# Altium schematic sheet ECG_AFE_ADS1292.SchDoc
size 420 x 297 mm; SheetNumber: 2; SheetTotal: 3
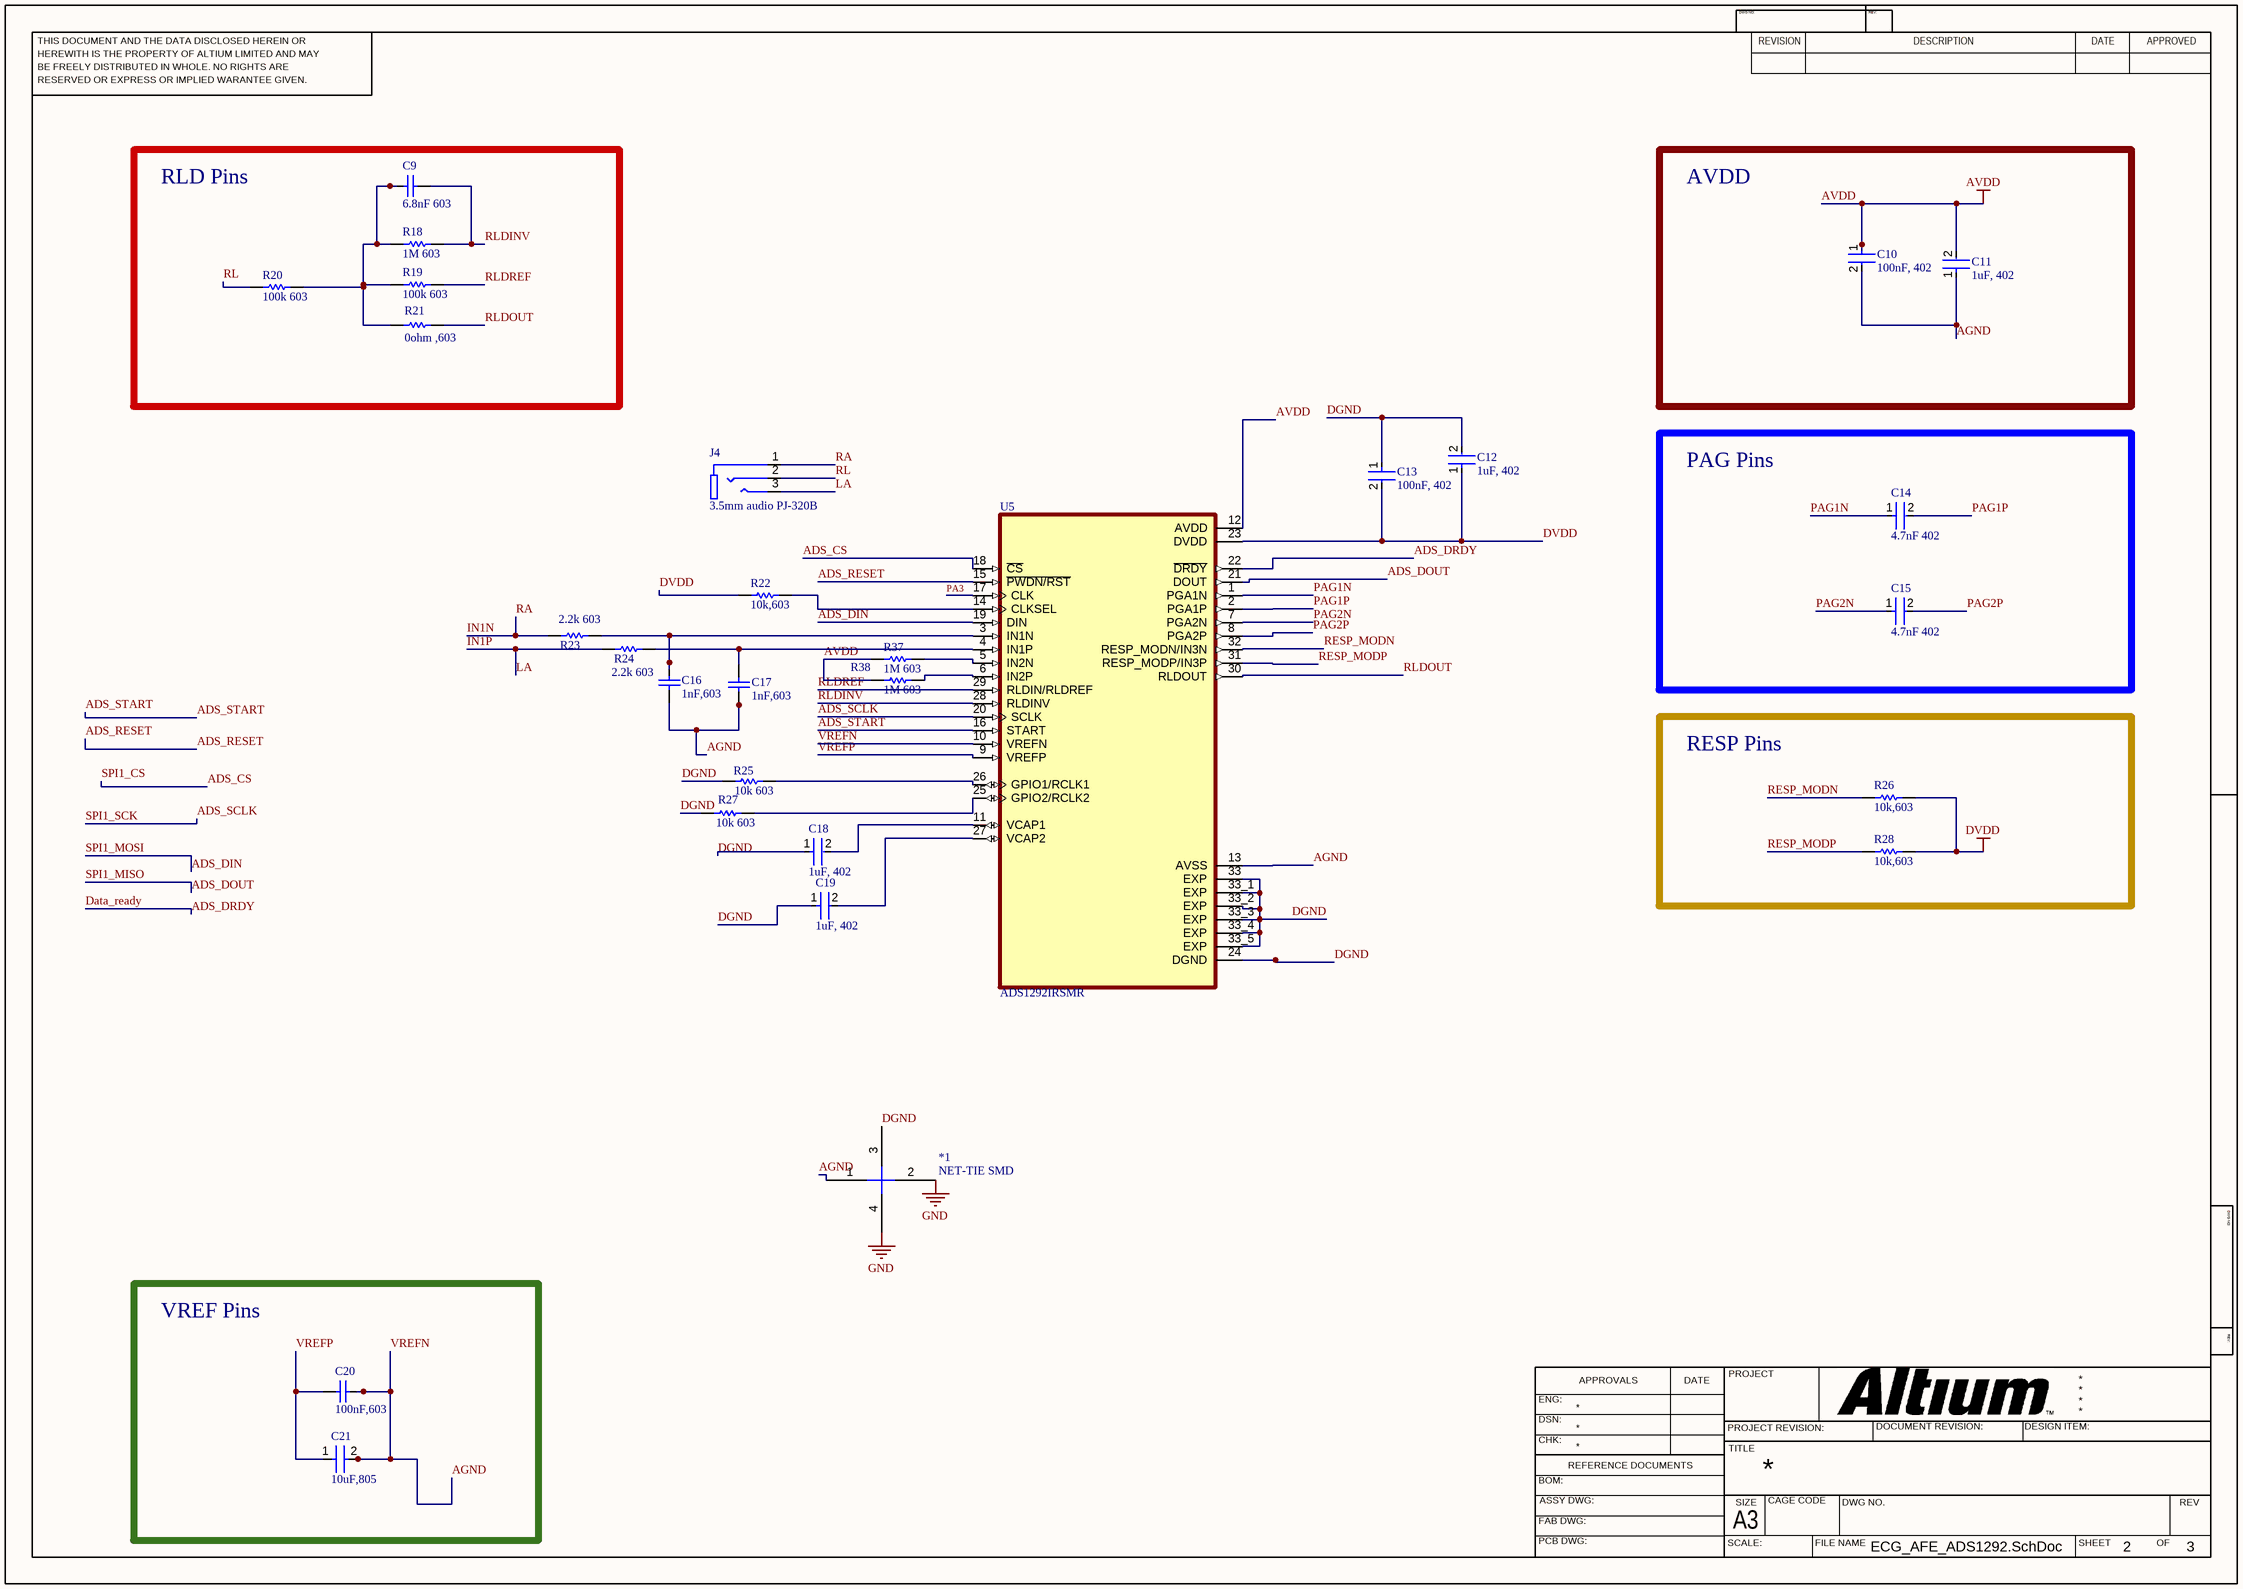
[diagram p0: ECG_AFE_ADS1292.SchDoc]

## Parts
*1  NET-TIE SMD  [NET TIE SMD]
C9  6.8nF 603  [CAP-0603-IPC_B]
C10  100nF, 402  [FP-CC0402-MFG]
C11  1uF, 402  [FP-CC0402-MFG]
C12  1uF, 402  [FP-CC0402-MFG]
C13  100nF, 402  [FP-CC0402-MFG]
C14  4.7nF 402  [FP-GRM188-0_1-e0_2_0_5-MFG]
C15  4.7nF 402  [FP-GRM188-0_1-e0_2_0_5-MFG]
C16  1nF,603  [CAP-0603-IPC_B]
C17  1nF,603  [CAP-0603-IPC_B]
C18  1uF, 402  [FP-CC0402-MFG]
C19  1uF, 402  [FP-CC0402-MFG]
C20  100nF,603  [CAP-0603-IPC_B]
C21  10uF,805  [CAP-0805-IPC_B]
J4  3.5mm audio PJ-320B  [3.5mm Audio PJ-320B]
R18  1M 603  [RES-0603-IPC_B]
R19  100k 603  [RES-0603-IPC_B]
R20  100k 603  [RES-0603-IPC_B]
R21  0ohm ,603  [RES-0603-IPC_B]
R22  10k,603  [RES-0603-IPC_B]
R23  2.2k 603  [RES-0603-IPC_B]
R24  2.2k 603  [RES-0603-IPC_B]
R25  10k 603  [RES-0603-IPC_B]
R26  10k,603  [RES-0603-IPC_B]
R27  10k 603  [RES-0603-IPC_B]
R28  10k,603  [RES-0603-IPC_B]
R37  1M 603  [RES-0603-IPC_B]
R38  1M 603  [RES-0603-IPC_B]
U5  ADS1292IRSMR  [ADS1292 SMD 32 PIN]

## Blocks framed on the sheet
RLD Pins: C9 R18-R21
AVDD: C10 C11
PAG Pins: C14 C15
RESP Pins: R26 R28
VREF Pins: C20 C21

## Nets
AVDD: C10.1 C11.2 R37.1 R38.1 U5.12(AVDD)
DVDD: C12.1 C13.2 R22.1 R26.2 R28.2 U5.23(DVDD)
GND: *1.2 *1.4
ADS_CS: U5.18(~{CS})  [also labelled SPI1_CS]
ADS_DIN: U5.19(DIN)  [also labelled SPI1_MOSI]
ADS_DOUT: U5.21(DOUT)  [also labelled SPI1_MISO]
ADS_DRDY: U5.22(~{DRDY})  [also labelled Data_ready]
ADS_RESET: U5.15(~{PWDN/RST})
ADS_SCLK: U5.20(SCLK)  [also labelled SPI1_SCK]
ADS_START: U5.16(START)
AGND: *1.1 C10.2 C11.1 C16.1 C17.1 C20.2 C21.2 U5.10(VREFN) U5.13(AVSS)  [also labelled VREFN]
DGND: *1.3 C12.2 C13.1 C18.1 C19.1 R25.1 R27.1 U5.24(DGND) U5.33(EXP) U5.33_1(EXP) U5.33_2(EXP) U5.33_3(EXP) U5.33_4(EXP) U5.33_5(EXP)
IN1N: J4.1(SLEEVE) R23.1  [also labelled RA]
IN1P: J4.3(TIP) R24.1  [also labelled LA]
PA3: U5.17(CLK)
PAG1N: C14.1 U5.1(PGA1N)
PAG1P: C14.2 U5.2(PGA1P)
PAG2N: C15.1 U5.7(PGA2N)
PAG2P: C15.2 U5.8(PGA2P)
RESP_MODN: R26.1 U5.32(RESP_MODN/IN3N)
RESP_MODP: R28.1 U5.31(RESP_MODP/IN3P)
RL: J4.2(RING) R20.1
RLDINV: C9.2 R18.2 U5.28(RLDINV)
RLDOUT: R21.2 U5.30(RLDOUT)
RLDREF: R19.2 U5.29(RLDIN/RLDREF)
VREFP: C20.1 C21.1 U5.9(VREFP)
NetC9_1: C9.1 R18.1 R19.1 R20.2 R21.1
NetC16_2: C16.2 R23.2 U5.3(IN1N)
NetC17_2: C17.2 R24.2 U5.4(IN1P)
NetC18_2: C18.2 U5.11(VCAP1)
NetC19_2: C19.2 U5.27(VCAP2)
NetR22_2: R22.2 U5.14(CLKSEL)
NetR25_2: R25.2 U5.26(GPIO1/RCLK1)
NetR27_2: R27.2 U5.25(GPIO2/RCLK2)
NetR37_2: R37.2 U5.5(IN2N)
NetR38_2: R38.2 U5.6(IN2P)

## Notes on the sheet
- THIS DOCUMENT AND THE DATA DISCLOSED HEREIN OR
- HEREWITH IS THE PROPERTY OF ALTIUM LIMITED AND MAY
- DWG NO:
- REVISION
- REV:
- DESCRIPTION
- DATE
- APPROVED
- BE FREELY DISTRIBUTED IN WHOLE. NO RIGHTS ARE
- RESERVED OR EXPRESS OR IMPLIED WARANTEE GIVEN.
- ENG:
- APPROVALS
- PROJECT
- DSN:
- CHK:
- REFERENCE DOCUMENTS
- PROJECT REVISION:
- TITLE
- DOCUMENT REVISION:
- DESIGN ITEM:
- BOM:
- FAB DWG:
- PCB DWG:
- ASSY DWG:
- SCALE:
- A3
- SIZE
- CAGE CODE
- FILE NAME
- DWG NO.
- SHEET
- OF
- REV

## Library data of the parts
C9 = 6.8nF CAP-0603-IPC-B_2: Manufacturer: AVX Interconnect / Elco; Part Number: 0603ZC103MAT2A
C10 C13 = CMP-03422-000048-1: CAP CER 0.1UF 16V X7R 0402; Manufacturer: YAGEO; Manufacturer Part Number: CC0402KRX7R7BB104; Material: Ceramic; Automotive Grade: NA; Temperature Coefficient: 30ppm/°C; Tolerance: 0.1; Device Class L1: Passive Components; Temperature Range Low: -55°C; Device Class L3: Ceramic Capacitors; Temperature Characteristic: X7R; Ipc Land Pattern Name: CAPC10050X50; Capacitance: 100 nF; Temperature Range High: +125°C; Voltage Rating: 16 V; Temperature: -55°C to +125°C; RoHS: TRUE; Automotive: No; Height: 0.55mm; Device Class L2: Capacitors; Digikey Description: CAP CER 0.1UF 16V X7R 0402; Package: CC0402; Footprint Url: http://www.yageo.com/exep/pages/download/literatures/UPY-C_GEN_24.pdf; ComponentLink2Description: Datasheet; Category: Cap; Lead Free: Yes; Value: 100 nF; Octopart: https://octopart.com/cc0402krx7r7bb104-yageo-42244624; ComponentLink2URL: http://www.yageo.com/documents/recent/UPY-GP_NP0_16V-to-50V_16.pdf; Mouser Description: 0402 0.1 uF 16 V ±10 % Tolerance X7R SMT Multilayer Ceramic Capacitor
C11 C12 C18 C19 = CMP-03422-000489-1: CAP CER 1UF 10V X5R 0402; Manufacturer Part Number: CC0402KRX5R6BB105; Manufacturer: YAGEO; Temperature Coefficient: 30ppm/°C; Tolerance: 0.1; Automotive Grade: NA; Material: Ceramic; Device Class L1: Passive Components; Ipc Land Pattern Name: CAPC10050X50; Height: 0.55mm; Voltage Rating: 10 V; Digikey Description: CAP CER 1UF 10V X5R 0402; RoHS: TRUE; Temperature: -55°C to +125°C; Octopart: https://octopart.com/cc0402krx5r6bb105-yageo-42244620; Mouser Description: Multilayer Ceramic Capacitors MLCC - SMD/SMT 1uF 10V X5R 10%; Temperature Characteristic: X5R; Category: Cap; Automotive: No; Temperature Range Low: -55°C; Value: 1 uF; ComponentLink2Description: Datasheet; Temperature Range High: +125°C; Package: CC0402; Capacitance: 1 uF; Footprint Url: http://www.yageo.com/exep/pages/download/literatures/UPY-C_GEN_24.pdf; ComponentLink2URL: http://www.yageo.com/documents/recent/UPY-GP_NP0_16V-to-50V_16.pdf; Lead Free: Yes; Device Class L3: Ceramic Capacitors; Device Class L2: Capacitors
C14 C15 = CMP-2006-02564-2: Chip Multilayer Ceramic Capacitors for General Purpose, 0603, 4700pF, C0G, 30ppm/°C, 5%, 50V; Case Code (Imperial): 0603; Width: 0.8mm; Package Quantity: 4000; Termination: SMD/SMT; Lead Free: Lead Free; Capacitance: 4.7nF; Voltage Rating (DC): 50V; Dielectric: C0G; Height: 0.8mm; Tolerance: 5%; Thickness: 0.035inch; Min Operating Temperature: -55°C; Voltage Rating: 50V; Mount: Surface Mount; Max Operating Temperature: 125°C; Case Code (Metric): 1608; REACH SVHC: No SVHC; Material: Ceramic; Length: 1.6mm; Packaging: Tape and Reel; Case/Package: 0603
C16 C17 = 1nF CAP-0603-IPC-B_1: Manufacturer: AVX Interconnect / Elco; Part Number: 0603ZC103MAT2A
C20 = 100nF CAP-0603-IPC-B_1: Manufacturer: AVX Interconnect / Elco; Part Number: 0603ZC103MAT2A
C21 = 10uF CAP 0805 10V: 50V 10uF X5R 卤10% 0805 Multilayer Ceramic Capacitors MLCC - SMD/SMT ROHS; Manufacturer: Samsung Electro-Mechanics; Manufacturer Part Number: CL21A106KBYQNNE; Value: 10µF; Tolerance: 10%; Supplier: Mouser; Supplier Part Number: 187-CL21A106KBYQNNE; RoHS: Compliant; Category: Ceramic Capacitors; Stock: 130399; Pricing: 1=0.49, 10=0.221, 50=0.221, 100=0.197, 1000=0.146, 10000=0.123 (USD); Case/Package: 0805; China RoHS: Compliant; Dielectric Material: Ceramic; Height: 1.45mm; Lifecycle Status: Production; Material: Ceramic; Max Operating Temperature: 85°C; Min Operating Temperature: -55°C; Mounting Technology: Surface Mount; Number of Terminals: 2; REACH SVHC: Yes; Voltage Rating: 50V; Voltage Rating (DC): 50V; ComponentLink1URL: https://datasheet.octopart.com:443/CL21A106KBYQNNE-Samsung-Electro-Mechanics-datasheet-182022676.pdf?src-supplier=IHS; ComponentLink1Description: https://datasheet.octopart.com:443/CL21A106KBYQNNE-Samsung-Electro-Mechanics-datasheet-182022676.pdf?src-supplier=IHS; ComponentLink2URL: https://datasheet.octopart.com:443/CL21A106KBYQNNE-Samsung-Electro-Mechanics-datasheet-141347528.pdf?src-supplier=Samsung+SCT; ComponentLink2Description: https://datasheet.octopart.com:443/CL21A106KBYQNNE-Samsung-Electro-Mechanics-datasheet-141347528.pdf?src-supplier=Samsung+SCT; ComponentLink3URL: https://datasheet.octopart.com:443/CL21A106KBYQNNE-Samsung-Electro-Mechanics-datasheet-149154152.pdf?src-supplier=Future+Electronics; ComponentLink3Description: https://datasheet.octopart.com:443/CL21A106KBYQNNE-Samsung-Electro-Mechanics-datasheet-149154152.pdf?src-supplier=Future+Electronics
J4 = 3.5mm audio PJ-320B: ÐŸÐ¾Ñ€Ñ‚ Ð´Ð»Ñ Ð½Ð°ÑƒÑˆÐ½Ð¸ÐºÐ¾Ð²; MF: Luoyang Dishang electronics; SnapEDA_Link: https://www.snapeda.com/parts/PJ-320B/Luoyang%20Dishang%20electronics/view-part/5519978/?ref=snap; Value: *; MP: PJ-320B; Availability: Not in stock; Check_prices: https://www.snapeda.com/parts/PJ-320B/Luoyang%20Dishang%20electronics/view-part/5519978/?ref=eda; Package: Package; Price: None
R18 R37 R38 = 1M RES-0603-IPC-B_3: Max Power Dissipation: 100mW; Temperature Coefficient: 50ppm/°C; Tolerance: 0.5%; Resistance: 4.7kR; Height: 0.022inch; Width: 0.032inch; RoHS Compliant: Yes; Features: Moisture Resistant; Packaging: Tape and Reel; Number of Terminations: 2; Max Operating Temperature: 155°C; Series: AT; Min Operating Temperature: -55°C; Resistor Type: Thin Film; Length: 0.063inch; Case/Package: 0603
R19 R20 = 100k RES-0603-IPC-B_1: Max Power Dissipation: 100mW; Temperature Coefficient: 50ppm/°C; Tolerance: 0.5%; Resistance: 4.7kR; Height: 0.022inch; Width: 0.032inch; RoHS Compliant: Yes; Features: Moisture Resistant; Packaging: Tape and Reel; Number of Terminations: 2; Max Operating Temperature: 155°C; Series: AT; Min Operating Temperature: -55°C; Resistor Type: Thin Film; Length: 0.063inch; Case/Package: 0603
R21 = 1k RES-0603-IPC-B_1: Max Power Dissipation: 100mW; Temperature Coefficient: 50ppm/°C; Tolerance: 0.5%; Resistance: 4.7kR; Height: 0.022inch; Width: 0.032inch; RoHS Compliant: Yes; Features: Moisture Resistant; Packaging: Tape and Reel; Number of Terminations: 2; Max Operating Temperature: 155°C; Series: AT; Min Operating Temperature: -55°C; Resistor Type: Thin Film; Length: 0.063inch; Case/Package: 0603
R22 R25-R28 = 10k RES-0603-IPC-B_1_1: Max Power Dissipation: 100mW; Temperature Coefficient: 50ppm/°C; Tolerance: 0.5%; Resistance: 4.7kR; Height: 0.022inch; Width: 0.032inch; RoHS Compliant: Yes; Features: Moisture Resistant; Packaging: Tape and Reel; Number of Terminations: 2; Max Operating Temperature: 155°C; Series: AT; Min Operating Temperature: -55°C; Resistor Type: Thin Film; Length: 0.063inch; Case/Package: 0603
R23 R24 = 1.18k RES-0603-IPC-B_3: Max Power Dissipation: 100mW; Temperature Coefficient: 50ppm/°C; Tolerance: 0.5%; Resistance: 4.7kR; Height: 0.022inch; Width: 0.032inch; RoHS Compliant: Yes; Features: Moisture Resistant; Packaging: Tape and Reel; Number of Terminations: 2; Max Operating Temperature: 155°C; Series: AT; Min Operating Temperature: -55°C; Resistor Type: Thin Film; Length: 0.063inch; Case/Package: 0603
U5 = ADS1292IRSMR: 24-bit, 2-ch, Low-Power Analog Front END (AFE) for ECG Applications; MF: Texas Instruments; SnapEDA_Link: https://www.snapeda.com/parts/ADS1292IRSMR/Texas+Instruments/view-part/?ref=snap; Package: VQFN-32 Texas Instruments; Value: *; MP: ADS1292IRSMR; Check_prices: https://www.snapeda.com/parts/ADS1292IRSMR/Texas+Instruments/view-part/?ref=eda